# Altium project Power_Board-V1.0.PrjPcb (part 1 of 2)
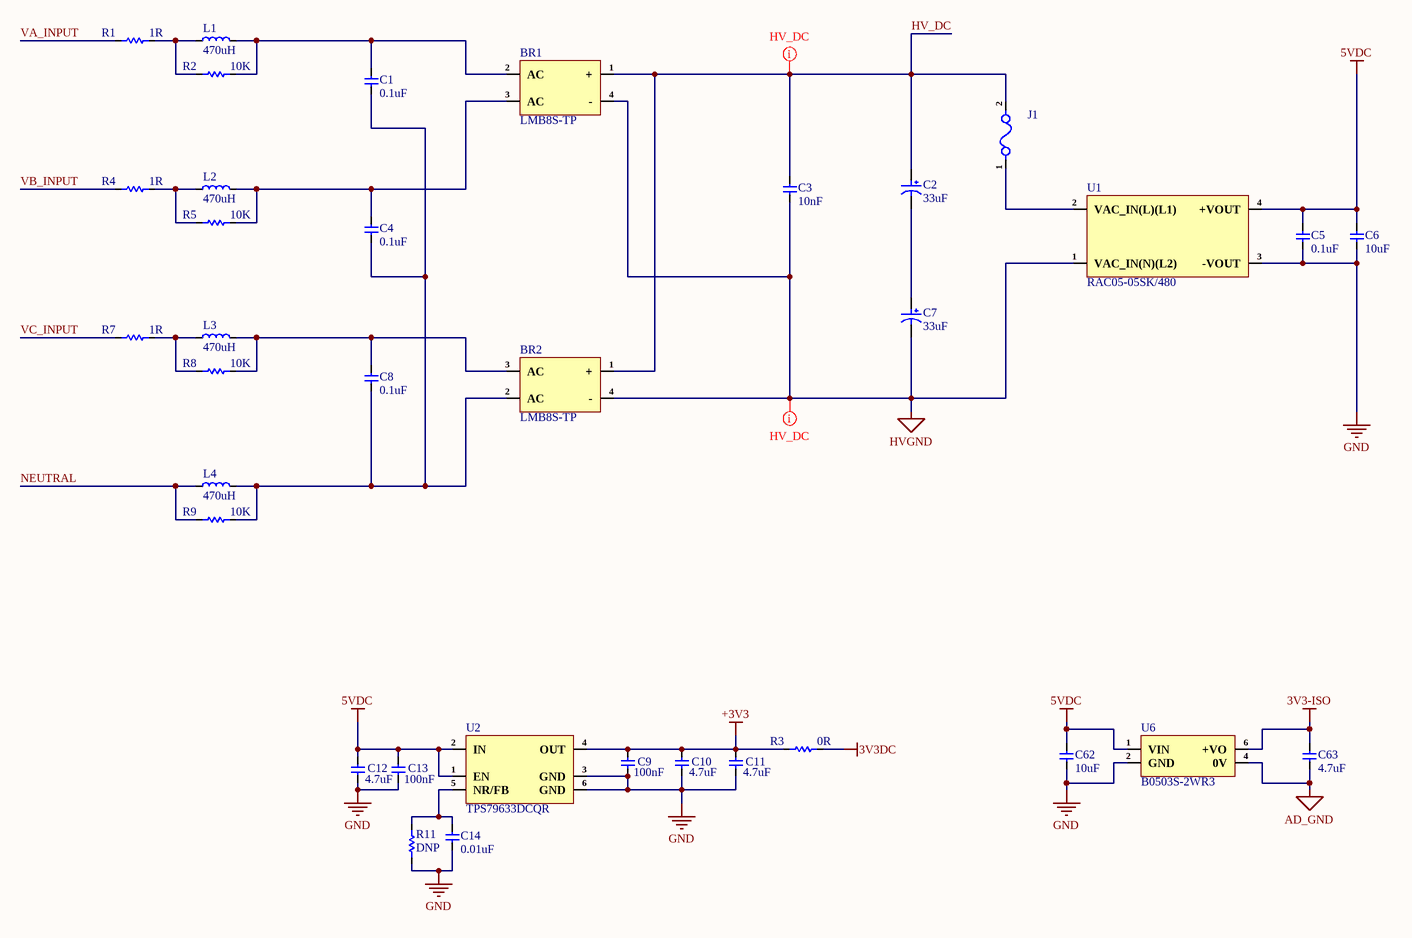
[diagram p0: Power_Supply_Sheet.SchDoc]
4 sheets, 203 parts. Net scope: global (net labels, ports and power ports of the same name join across sheets).
Board file: Power_Board-V1.0.PcbDoc
Sheets:
  Power_Supply_Sheet.SchDoc
  Metering_Sheet.SchDoc
  Interface_Sheet.SchDoc
  Connector_Sheet.SchDoc

## Sheet Power_Supply_Sheet.SchDoc
size 420 x 297 mm; SheetNumber: 1; SheetTotal: 4

### Parts
BR1  LMB8S-TP  [LMBS-1]
BR2  LMB8S-TP  [LMBS-1]
C1  0.1uF  [B32921C3104M000]
C2  33uF  [87EC0494]
C3  10nF  [MPBH103J3A0701]
C4  0.1uF  [B32921C3104M000]
C5  0.1uF  [Cap-0805]
C6  10uF  [Cap-1210]
C7  33uF  [87EC0494]
C8  0.1uF  [B32921C3104M000]
C9  100nF  [Cap-0603]
C10  4.7uF  [Cap-0603]
C11  4.7uF  [Cap-0603]
C12  4.7uF  [Cap-0603]
C13  100nF  [Cap-0603]
C14  0.01uF  [Cap-0603]
C62  10uF  [Cap-0603]
C63  4.7uF  [Cap-0603]
J1  01550900M  [01550900M]  (value not drawn)
L1  470uH  [XRNR6045-470uH/M]
L2  470uH  [XRNR6045-470uH/M]
L3  470uH  [XRNR6045-470uH/M]
L4  470uH  [XRNR6045-470uH/M]
R1  1R  [RES-2512]
R2  10K  [Res-1206]
R3  0R  [Res-0603]
R4  1R  [RES-2512]
R5  10K  [Res-1206]
R7  1R  [RES-2512]
R8  10K  [Res-1206]
R9  10K  [Res-1206]
R11  DNP  [Res-0603]
U1  RAC05-05SK/480  [RAC05-05SK/480]
U2  TPS79633DCQR  [SOT-223-6_]
U6  B0503S-2WR3  [B0503S-2WR3]

### Nets
3V3-ISO: C63.2 U6.6(+VO)
3V3DC: R3.1
5VDC: C5.2 C6.2 C12.2 C13.2 C62.2 U1.4(+VOUT) U2.1(EN) U2.2(IN) U6.1(VIN)
+3V3: C9.2 C10.2 C11.2 R3.2 U2.4(OUT)
AD_GND: C63.1 U6.4(0V)
GND: C5.1 C6.1 C9.1 C10.1 C11.1 C12.1 C13.1 C14.1 C62.1 R11.1 U1.3(-VOUT) U2.3(GND) U2.6(GND) U6.2(GND)
HVGND: BR1.4(-) BR2.4(-) C3.1 C7.2 U1.1(VAC_IN(N)(L2))
HV_DC: BR1.1(+) BR2.1(+) C2.1 C3.2 J1.2
NEUTRAL: L4.1 R9.1
VA_INPUT: R1.1
VB_INPUT: R4.1
VC_INPUT: R7.1
NetBR1_2: BR1.2(AC) C1.2 L1.2 R2.2
NetBR1_3: BR1.3(AC) C4.2 L2.2 R5.2
NetBR2_2: BR2.2(AC) C1.1 C4.1 C8.1 L4.2 R9.2
NetBR2_3: BR2.3(AC) C8.2 L3.2 R8.2
NetC2_2: C2.2 C7.1
NetC14_2: C14.2 R11.2 U2.5(NR/FB)
NetJ1_1: J1.1 U1.2(VAC_IN(L)(L1))
NetL1_1: L1.1 R1.2 R2.1
NetL2_1: L2.1 R4.2 R5.1
NetL3_1: L3.1 R7.2 R8.1

### Layout directives
net class HV_DC: HV_DC, HVGND

### Notes on the sheet
- File:
- Title:
- Date:
- Page
- Num:
- Total:
- Drawn By: Huzaifa Ali

### Library data of the parts
BR1 BR2 = LMB8S-TP: 30A 950mV@400mA 1A 800V LMBS-1 Bridge Rectifiers ROHS; Manufacturer: MCC(Micro Commercial Components); Manufacturer Part Number: LMB8S-TP; Package: LMBS-1; LCSC Part Number: C435904; Item Type: Bridge; ComponentLink1Description: LCSC; ComponentLink1URL: https://www.lcsc.com/product-detail/Bridge-Rectifiers_MCC-Micro-Commercial-Components-LMB8S-TP_C435904.html?s_z=n_MB8S-TP
C1 C4 C8 = B32921C3104M000: CAP FILM 0.1UF 20% 630VDC RADIAL; Manufacturer: TDK EPCOS; Item Type: Film Capacitors; Dielectric Material: Polypropylene; Value: 100nF; Voltage: 630V; Dielectric: PP; Voltage Rating (AC): 305V; Insulation Resistance: 100R; Dissipation Factor: 1%; Lead Diameter: 0.6mm; Lead Length: 6mm; Ratings: X2; Supplier: Rs; LCSC Part Number: C361368; Manufacturer Part Number: B32921C3104M000; RoHS: Yes; Stock: 6670; Pricing: 100=1.997, 250=1.855, 500=1.75, 1000=1.571 (DKK); Mounting Technology: Through Hole; Case/Package: Radial; Pins: 2NUMBER; Min Operating Temperature: -40°C; Max Operating Temperature: 110°C; Tolerance: 20%; Termination: PC Pins; Series: B32921; Voltage Rating (DC): 630V; Length: 13mm; Height: 12mm; Lead Pitch: 10mm; Depth: 6mm; Reach SVHC Compliant: No; RoHS Compliant: Yes; ComponentLink1URL: https://datasheet.ciiva.com/48779/1833206-48779695.pdf?src-supplier=Element14; ComponentLink1Description: https://datasheet.ciiva.com/48779/1833206-48779695.pdf?src-supplier=Element14
C2 C7 = 87EC0494: 33uF 420V 1Ω@100kHz 430mA@100kHz ±20% Plugin,D10xL16mm Aluminum Electrolytic Capacitors - Leaded ROHS; Manufacturer: KNSCHA; Manufacturer Part Number: 87EC0494; Package: Plugin,D10xL16mm; LCSC Part Number: C6718366; Item Type: Capacitor; ComponentLink1Description: LCSC; ComponentLink1URL: https://www.lcsc.com/product-detail/Aluminum-Electrolytic-Capacitors-Leaded_KNSCHA-87EC0494_C6718366.html
C3 = MPBH103J3A0701: 10nF -40℃~+100℃ ±5% 1kV Through Hole,P=7.5mm Film Capacitors RoHS; Manufacturer: KYET; Manufacturer Part Number: MPBH103J3A0701; Package: Through Hole,P=7.5mm; LCSC Part Number: C2928848; Item Type: Capacitor; ComponentLink1Description: LCSC; ComponentLink1URL: https://www.lcsc.com/product-detail/C2928848.html
C5 = CL21B104KBCNNNC: Multilayer Ceramic Capacitor, 0.1 uF, 50 V, ± 10%, X7R, 0805 [2012 Metric]; Manufacturer: Samsung; Value: 100nF; Voltage Rating: 50V; Supplier: Digikey; Supplier Part Number: 1276-1003-1-ND; Manufacturer Part Number: CL21B104KBCNNNC; RoHS: Yes; Category: Ceramic Capacitors; Stock: 2193973; Pricing: 1=0.1, 10=0.042, 50=0.024, 100=0.0186, 500=0.01404, 1000=0.01103 (USD); Mounting Technology: Surface Mount; Case/Package: 0805; Case Code (Metric): 2012; Case Code (Imperial): 0805; Material: Ceramic; Min Operating Temperature: -55°C; Max Operating Temperature: 125°C; Tolerance: 10%; Dielectric: X7R; Packaging: Tape and Reel; Voltage: 50V; Series: CL; Construction: Flat; Voltage Rating (DC): 50V; Length: 2mm; Width: 0.049inch; Height: 0.85mm; Depth: 1.25mm; Thickness: 0.037inch; Radiation Hardening: No; RoHS Compliant: Yes; Lead Free: 5697LeadFree; ComponentLink1URL: https://datasheet.ciiva.com/25710/cl21b104kbcnnnc-25710182.pdf?src-supplier=Digikey; ComponentLink1Description: https://datasheet.ciiva.com/25710/cl21b104kbcnnnc-25710182.pdf?src-supplier=Digikey; ComponentLink2URL: https://datasheet.ciiva.com/29199/454152-da-01-en-vs-kondensator-0805-29199814.pdf?src-supplier=Conrad; ComponentLink2Description: https://datasheet.ciiva.com/29199/454152-da-01-en-vs-kondensator-0805-29199814.pdf?src-supplier=Conrad; Item Type: Capacitor
C6 = CC1210KKX7R9BB106: CAP CER 10UF 50V X7R 1210; Manufacturer: Yageo; Item Type: Capacitors; Tolerance: 10%; Supplier: Farnell; LCSC Part Number: C596319; Manufacturer Part Number: CC1210KKX7R9BB106; RoHS: Yes; Stock: 76; Mounting Technology: Surface Mount; Case/Package: 1210; Case Code (Metric): 3225; Case Code (Imperial): 1210; Min Operating Temperature: -55°C; Max Operating Temperature: 125°C; Value: 10uF; Dielectric: X7R; Packaging: Cut Tape; Voltage Rating: 50V; Voltage Rating (DC): 50V; Series: CC; Length: 0.126inch; Width: 0.098inch; Thickness: 0.11inch; Lead Free: Lead Free; Halogen Free: Halogen Free; RoHS Compliant: Yes; ComponentLink1URL: https://datasheet.octopart.com/CC1210KKX7R9BB106-Yageo-datasheet-147453679.pdf?src-supplier=Newark; ComponentLink1Description: https://datasheet.octopart.com/CC1210KKX7R9BB106-Yageo-datasheet-147453679.pdf?src-supplier=Newark; ComponentLink2URL: https://datasheet.octopart.com/CC1210KKX7R9BB106-Yageo-datasheet-166511530.pdf?src-supplier=Future+Electronics; ComponentLink2Description: https://datasheet.octopart.com/CC1210KKX7R9BB106-Yageo-datasheet-166511530.pdf?src-supplier=Future+Electronics; ComponentLink3URL: http://www.yageo.com/documents/recent/UPY-GPHC_X7R_6.3V-to-50V_18.pdf?src-supplier=Digikey; ComponentLink3Description: http://www.yageo.com/documents/recent/UPY-GPHC_X7R_6.3V-to-50V_18.pdf?src-supplier=Digikey; ComponentLink4URL: http://www.yageo.com/exep/pages/download/literatures/ProductSelectionGuide%202014_Final_2.pdf?src-supplier=Digikey; ComponentLink4Description: http://www.yageo.com/exep/pages/download/literatures/ProductSelectionGuide%202014_Final_2.pdf?src-supplier=Digikey; ComponentLink5URL: https://datasheet.octopart.com/CC1210KKX7R9BB106-Yageo-datasheet-151948686.pdf?src-supplier=Farnell; ComponentLink5Description: https://datasheet.octopart.com/CC1210KKX7R9BB106-Yageo-datasheet-151948686.pdf?src-supplier=Farnell
C9 C13 = CC0603JRX7R8BB104: CAP CER 0.1UF 25V X7R 0603; Manufacturer: Yageo; Tolerance: 5%; Item Type: Capacitors; Manufacturer Part Number: CC0603JRX7R8BB104; RoHS: Yes; Dielectric: X7R; LCSC Part Number: C327087; ComponentLink1Description: https://datasheet.ciiva.com/11465/upy-gphc-x7r-6-3v-to-50v-8-11465031.pdf?src-supplier=Avnet; ComponentLink1URL: https://datasheet.ciiva.com/11465/upy-gphc-x7r-6-3v-to-50v-8-11465031.pdf?src-supplier=Avnet; Supplier: Digikey; Stock: 448767; Pricing: 1=0.1, 10=0.057, 50=0.039, 100=0.0335, 500=0.02436, 1000=0.0215 (USD); Mounting Technology: Surface Mount; Case/Package: 0603; Case Code (Imperial): 0603; Case Code (Metric): 1608; Weight: 7.1E-05oz; Min Operating Temperature: -55°C; Max Operating Temperature: 125°C; Voltage Rating: 25V; Voltage Rating (DC): 25V; Packaging: Tape and Reel; Value: 100nF; Termination: SMD/SMT; Series: CC; Construction: Flat; Length: 1.6mm; Width: 0.031inch; Height: 0.8mm; Thickness: 0.035inch; Lead Free: Lead Free; Halogen Free: Halogen Free; RoHS Compliant: Yes
C10-C12 = CC0603KRX5R7BB475: CAP CER 4.7UF 16V X5R 0603; Manufacturer: Yageo; Item Type: Capacitor; Tolerance: 10%; LCSC Part Number: C277476; Manufacturer Part Number: CC0603KRX5R7BB475; RoHS: Yes; Case/Package: 0603; Case Code (Metric): 1608; Case Code (Imperial): 0603; Weight: 7.1E-05oz; Min Operating Temperature: -55°C; Max Operating Temperature: 85°C; Packaging: Tape and Reel; Voltage Rating: 16V; Dielectric: X5R; Termination: SMD/SMT; Voltage Rating (DC): 16V; Series: CC; Height: 0.8mm; RoHS Compliant: Yes; Halogen Free: Halogen Free; Lead Free: Lead Free; ComponentLink1URL: http://www.mouser.com/ds/2/447/UPY-GPHC_X5R_4V-to-50V_25-1131599.pdf?src-supplier=Mouser; ComponentLink1Description: http://www.mouser.com/ds/2/447/UPY-GPHC_X5R_4V-to-50V_25-1131599.pdf?src-supplier=Mouser; ComponentLink2URL: http://www.yageo.com/documents/recent/UPY-GPHC_X5R_4V-to-50V_25.pdf?src-supplier=Digi-Key; ComponentLink2Description: http://www.yageo.com/documents/recent/UPY-GPHC_X5R_4V-to-50V_25.pdf?src-supplier=Digi-Key; Supplier 1: Digi-Key; Category: Ceramic Capacitors; Stock 1: 547703; Pricing 1: 1=0.20000, 10=0.13800, 50=0.08280, 100=0.06990, 500=0.04784, 1000=0.04233 (USD); Mount: Surface Mount; Capacitance: 4.7uF; Resistor Type: Ceramic; Length: 1.6mm; Width: 0.8mm; Thickness: 0.037inch; Depth: 0.8mm; Supplier Part Number 1: 311-1785-1-ND
C14 = GRM1885C1H103JA01D: CAP CER 10000PF 50V C0G/NP0 0603; Manufacturer: Murata; Material: Ceramic; Tolerance: 5%; Dielectric: C0G; Capacitance: 10nF; Manufacturer Part Number: GRM1885C1H103JA01D; RoHS: Yes; Category: Ceramic Capacitors; Case/Package: 0603; Case Code (Imperial): 0603; Case Code (Metric): 1608; Min Operating Temperature: -55°C; Max Operating Temperature: 125°C; Voltage: 50V; Packaging: Tape and Reel; Voltage Rating: 50V; Package Quantity: 4000; Voltage Rating (DC): 50V; Termination: SMD/SMT; Series: GRM; Length: 1.6mm; Width: 0.8mm; Height: 0.8mm; Depth: 0.8mm; RoHS Compliant: Yes; Lead Free: Lead Free; ComponentLink1URL: https://datasheet.ciiva.com/41860/partnumbering-e-01-41860759.pdf?src-supplier=Digi-Key; ComponentLink1Description: https://datasheet.ciiva.com/41860/partnumbering-e-01-41860759.pdf?src-supplier=Digi-Key; ComponentLink2URL: https://datasheet.ciiva.com/29537/partnumbering-e-01-29537910.pdf?src-supplier=Digi-Key; ComponentLink2Description: https://datasheet.ciiva.com/29537/partnumbering-e-01-29537910.pdf?src-supplier=Digi-Key; Supplier 1: RSComponents; Stock 1: 80000; Pricing 1: 4000=0.03500, 8000=0.03200 (GBP); Mount: Surface Mount; Thickness: 0.035inch; Lead Pitch: 0.5mm; REACH SVHC: No SVHC; Supplier Part Number 1: 1449032
C62 = GRM188Z71A106KA73D: CAP CER 10UF 10V X7R 0603; Manufacturer: Murata; Item Type: Capacitor; Material: 4241ConductorMaterial; Tolerance: 10%; Supplier: Mouser; LCSC Part Number: C2959727; Manufacturer Part Number: GRM188Z71A106KA73D; RoHS: Yes; Stock: 390983; Pricing: 1=0.36, 10=0.155, 50=0.155, 100=0.104, 1000=0.094, 10000=0.065 (USD); Case/Package: 345Case; Min Operating Temperature: -55°C; Max Operating Temperature: 125°C; Value: 10uF; Voltage Rating: 10V; Length: 1.6mm; Width: 800um; Height: 1mm; Thickness: 800um; RoHS Compliant: Yes; ComponentLink1URL: https://datasheet.octopart.com/GRM188Z71A106KA73D-Murata-datasheet-165579666.pdf?src-supplier=TME; ComponentLink1Description: https://datasheet.octopart.com/GRM188Z71A106KA73D-Murata-datasheet-165579666.pdf?src-supplier=TME
C63 = GRM188Z71A475KE15D: CAP CER 4.7UF 10V X7R 0603; Manufacturer: Murata; Item Type: Capacitors; Material: 4241ConductorMaterial; Tolerance: 10%; Supplier: Mouser; LCSC Part Number: C913474; Manufacturer Part Number: GRM188Z71A475KE15D; RoHS: Yes; Stock: 33218; Pricing: 1=0.24, 10=0.1, 50=0.1, 100=0.063, 1000=0.055, 10000=0.041 (USD); Case/Package: 0603; Min Operating Temperature: -55°C; Max Operating Temperature: 125°C; Value: 4.7uF; Voltage Rating: 10V; Length: 1.6mm; Width: 800um; Height: 950um; Thickness: 800um; RoHS Compliant: Yes; ComponentLink1URL: https://datasheet.octopart.com/GRM188Z71A475KE15D-Murata-datasheet-149523299.pdf?src-supplier=Newark; ComponentLink1Description: https://datasheet.octopart.com/GRM188Z71A475KE15D-Murata-datasheet-149523299.pdf?src-supplier=Newark; ComponentLink2URL: https://datasheet.octopart.com/GRM188Z71A475KE15D-Murata-datasheet-165579666.pdf?src-supplier=TME; ComponentLink2Description: https://datasheet.octopart.com/GRM188Z71A475KE15D-Murata-datasheet-165579666.pdf?src-supplier=TME
J1 = 01550900M: FUSE BLOK CARTRIDGE 125V 10A SMD; Manufacturer: Littelfuse; Item Type: Fuse Holders; Supplier: Digikey; LCSC Part Number: C108518; Manufacturer Part Number: 01550900M; RoHS: Yes; Stock: 4038; Pricing: 1=2.5, 5=2.072, 10=1.912, 50=1.586, 100=1.4631, 250=1.31448, 500=1.21164, 1000=1.11633, 5000=1.06138 (USD); Lead Free: 5697LeadFree; Reach SVHC Compliant: 4187SVHC; ComponentLink1URL: https://datasheet.ciiva.com/3812/01550900m-3812998.pdf?src-supplier=Arrow+Electronics; ComponentLink1Description: https://datasheet.ciiva.com/3812/01550900m-3812998.pdf?src-supplier=Arrow+Electronics
L1-L4 = XRNR6045-470uH/M: 420mA 470uH Magnetic Shielded Inductor ±20% 500mA 1.8Ω SMD,6x6mm Fixed Inductors ROHS; Manufacturer: XR; Manufacturer Part Number: XRNR6045-470uH/M; Package: SMD,6x6mm; LCSC Part Number: C5339751; Item Type: Inductor
R1 R4 R7 = HoLRT2512-3W-1R-1: 3W 1Ω SMD ±50ppm/℃ Current Sense Resistor ±1% 2512 Chip Resistor - Surface Mount RoHS; Manufacturer: Milliohm; Manufacturer Part Number: HoLRT2512-3W-1R-1; Package: 2512; LCSC Part Number: C5127857; Item Type: Resistor; ComponentLink1Description: LCSC; ComponentLink1URL: https://www.lcsc.com/product-detail/C5127857.html
R2 R5 R8 R9 = AC1206FR-7W10KL: RES 10K OHM 1% 1/2W 1206; Manufacturer: Yageo; Item Type: Resistors; Value: 10kR; Supplier: Mouser; LCSC Part Number: C326700; Manufacturer Part Number: AC1206FR-7W10KL; RoHS: No; Stock: 10222; Pricing: 1=0.14, 10=0.052, 50=0.052, 100=0.029, 1000=0.018, 10000=0.011 (USD); Case/Package: 340Case; Packaging: 10Packaging
R3 R11 = RC0603JR-070RL: RES 0 OHM JUMPER 1/10W 0603; Manufacturer: Yageo; Resistance: 0mR; Tolerance: 1%; Power Rating: 100mW; Voltage Rating (DC): 50V; Temperature Coefficient: 200ppm/°C; Resistance Tolerance: 5%; Item Type: Resistor; Supplier 1: Digi-Key; Manufacturer Part Number: RC0603JR-070RL; RoHS: Yes; Category: Chip SMD Resistors; Stock 1: 18081776; Pricing 1: 1=0.10000, 10=0.01700, 25=0.01240, 50=0.00960, 100=0.00700, 250=0.00536, 500=0.00430, 1000=0.00316 (USD); Case/Package: 0603; Number of Pins: 2; Contact Plating: Tin,Matte; Case Code (Imperial): 0603; Case Code (Metric): 1608; Size Code: 0603; Min Operating Temperature: -55°C; Max Operating Temperature: 155°C; Resistor Type: Thick Film; Packaging: Tape and Reel; Termination: SMD/SMT; Series: RC; Technology: THICK FILM; Package Quantity: 5000; Voltage Rating: 50V; Features: Moisture Resistant; Max Power Dissipation: 100mW; Number of Terminations: 2; Construction: Rectangular; Length: 1.6mm; Width: 0.8mm; Height: 0.45mm; Depth: 0.8mm; Radiation Hardening: No; Reach SVHC Compliant: No SVHC; Lead Free: Lead Free; RoHS Compliant: Yes; Military Standard: Not; Supplier Part Number 1: 311-0.0GRCT-ND; LCSC Part Number: C95177
U1 = RAC05-05SK/480: AC/DC CONVERTER 5V 5W; Manufacturer: Recom Power; Item Type: Voltage Regulators - Switching; Approvals: CE, EN, IEC, UL; Efficiency: 63%; Max Supply Voltage: 528V; Max Output current: 1A; Max Output Voltage: 5.05V; Min Input Voltage: 85V; Min Output Voltage: 4.95V; Nominal Supply Voltage: 480V; Number of Circuits: 1; Supplier: DigiKey; Supplier Part Number: 945-3185-ND; Manufacturer Part Number: RAC05-05SK/480; RoHS: Compliant; Stock: 856; Pricing: 1=18.3, 5=17.424, 10=17.063, 25=16.596, 50=16.251, 100=15.9134, 250=15.47772, 500=15.15614 (USD); Height: 23mm; Height - Seated (Max): 23.5mm; Length: 52.5mm; Lifecycle Status: Production; Max Operating Temperature: 60°C; Max Output Power: 5W; Min Operating Temperature: -40°C; Nominal Output Voltage: 5V; Number of Outputs: 1; Number of Terminals: 4; Output Current: 1A; Output Power: 5W; Output Voltage: 5V; REACH SVHC: Yes; Schedule B: 8504409580; Weight: 58g; Width: 27.4mm; ComponentLink1URL: https://datasheet.octopart.com:443/RAC05-05SK-480-Recom-Power-datasheet-181184451.pdf?src-supplier=IHS; ComponentLink1Description: https://datasheet.octopart.com:443/RAC05-05SK-480-Recom-Power-datasheet-181184451.pdf?src-supplier=IHS; ComponentLink2URL: https://datasheet.octopart.com:443/RAC05-05SK-480-Recom-Power-datasheet-133924410.pdf?src-supplier=Farnell; ComponentLink2Description: https://datasheet.octopart.com:443/RAC05-05SK-480-Recom-Power-datasheet-133924410.pdf?src-supplier=Farnell; ComponentLink3URL: https://datasheet.octopart.com:443/RAC05-05SK-480-Recom-Power-datasheet-148822129.pdf?src-supplier=Electro+Sonic; ComponentLink3Description: https://datasheet.octopart.com:443/RAC05-05SK-480-Recom-Power-datasheet-148822129.pdf?src-supplier=Electro+Sonic; ComponentLink4URL: https://datasheet.octopart.com:443/RAC05-05SK-480-Recom-Power-datasheet-138144762.pdf?src-supplier=RS+(Formerly+Allied+Electronics); ComponentLink4Description: https://datasheet.octopart.com:443/RAC05-05SK-480-Recom-Power-datasheet-138144762.pdf?src-supplier=RS+(Formerly+Allied+Electronics); ComponentLink5URL: https://datasheet.octopart.com:443/RAC05-05SK-480-Recom-Power-datasheet-165581948.pdf?src-supplier=TME; ComponentLink5Description: https://datasheet.octopart.com:443/RAC05-05SK-480-Recom-Power-datasheet-165581948.pdf?src-supplier=TME
U2 = TPS79633DCQR: IC REG LINEAR 3.3V 1A SOT223-6; Manufacturer: Texas Instruments; Supplier: Mouser; Supplier Part Number: 595-TPS79633DCQR; Manufacturer Part Number: TPS79633DCQR; RoHS: Yes; Category: Voltage Regulators - Linear; Stock: 3089; Pricing: 1=3.24, 10=2.75, 50=2.75, 100=2.39, 1000=1.72, 10000=1.56 (USD); Length: 6.5mm; Width: 3.5mm; Thickness: 1.6mm; ComponentLink1URL: https://datasheet.ciiva.com/2045/tps79601-2045264.pdf?src-supplier=Digi-Key; ComponentLink1Description: https://datasheet.ciiva.com/2045/tps79601-2045264.pdf?src-supplier=Digi-Key; ComponentLink2URL: https://datasheet.ciiva.com/22704/1846966-22704703.pdf?src-supplier=Element14; ComponentLink2Description: https://datasheet.ciiva.com/22704/1846966-22704703.pdf?src-supplier=Element14; ComponentLink3URL: https://datasheet.ciiva.com/41462/001015136-da-01-en-ic-reg-ldo-3-3v-1-tps79633dcqr-sot-6-tid-41462982.pdf?src-supplier=Conrad; ComponentLink3Description: https://datasheet.ciiva.com/41462/001015136-da-01-en-ic-reg-ldo-3-3v-1-tps79633dcqr-sot-6-tid-41462982.pdf?src-supplier=Conrad; LCSC Part Number: C485803; Item Type: IC
U6 = B0503S-2WR3: SIP-4 Isolated Power Modules ROHS; Manufacturer: YLPTEC; Item Type: Module; Manufacturer Part Number: B0503S-2WR3; Package: SIP-4; LCSC Part Number: C5369472; ComponentLink1Description: LCSC; ComponentLink1URL: https://www.lcsc.com/product-detail/Isolated-Power-Modules_YLPTEC-B0503S-2WR3_C5369472.html?s_z=n_B0503S-2WR3

## Sheet Metering_Sheet.SchDoc
size 420 x 297 mm; SheetNumber: 2; SheetTotal: 4
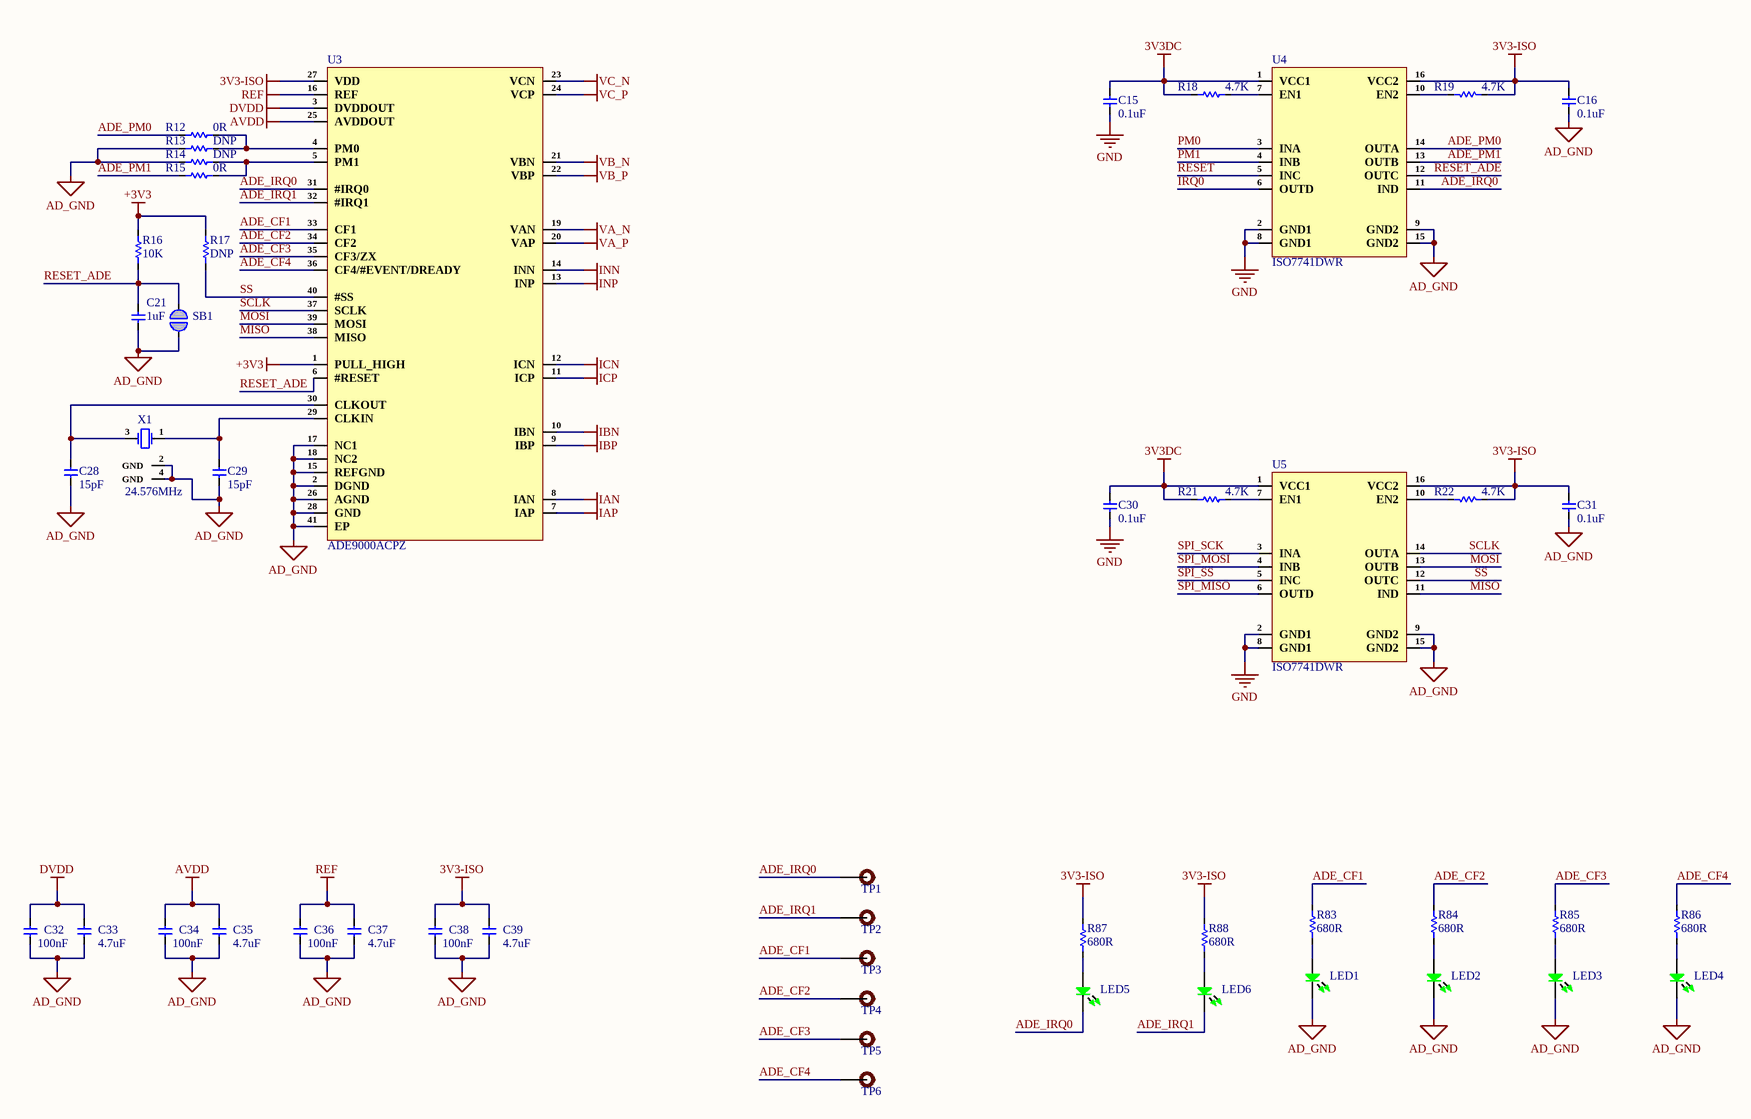
[diagram p1: Metering_Sheet.SchDoc]

### Parts
C15  0.1uF  [Cap-0603]
C16  0.1uF  [Cap-0603]
C21  1uF  [Cap-0402]
C28  15pF  [Cap-0603]
C29  15pF  [Cap-0603]
C30  0.1uF  [Cap-0603]
C31  0.1uF  [Cap-0603]
C32  100nF  [Cap-0402]
C33  4.7uF  [Cap-0402]
C34  100nF  [Cap-0402]
C35  4.7uF  [Cap-0402]
C36  100nF  [Cap-0402]
C37  4.7uF  [Cap-0402]
C38  100nF  [Cap-0402]
C39  4.7uF  [Cap-0402]
LED1  Emerald  [LED-0603]  (value not drawn)
LED2  Emerald  [LED-0603]  (value not drawn)
LED3  Emerald  [LED-0603]  (value not drawn)
LED4  Emerald  [LED-0603]  (value not drawn)
LED5  Emerald  [LED-0603]  (value not drawn)
LED6  Emerald  [LED-0603]  (value not drawn)
R12  0R  [Res-0402]
R13  DNP  [Res-0402]
R14  DNP  [Res-0402]
R15  0R  [Res-0402]
R16  10K  [Res-0402]
R17  DNP  [Res-0402]
R18  4.7K  [Res-0603]
R19  4.7K  [Res-0603]
R21  4.7K  [Res-0603]
R22  4.7K  [Res-0603]
R83  680R  [Res-0603]
R84  680R  [Res-0603]
R85  680R  [Res-0603]
R86  680R  [Res-0603]
R87  680R  [Res-0603]
R88  680R  [Res-0603]
SB1  Solder Bridge 0603  [Solder Bridge]  (value not drawn)  (no BOM)
TP1  TEST POINT  [Test-point]  (value not drawn)  (no BOM)
TP2  TEST POINT  [Test-point]  (value not drawn)  (no BOM)
TP3  TEST POINT  [Test-point]  (value not drawn)  (no BOM)
TP4  TEST POINT  [Test-point]  (value not drawn)  (no BOM)
TP5  TEST POINT  [Test-point]  (value not drawn)  (no BOM)
TP6  TEST POINT  [Test-point]  (value not drawn)  (no BOM)
U3  ADE9000ACPZ  [40-LFCSP-WQ (6x6)]
U4  ISO7741DWR  [SOIC-16-300mil]
U5  ISO7741DWR  [SOIC-16-300mil]
X1  24.576MHz  [SMD3225-4P]

### Nets
3V3-ISO: C16.2 C31.2 C38.2 C39.2 R19.2 R22.2 R87.2 R88.2 U3.27(VDD) U4.16(VCC2) U5.16(VCC2)
3V3DC: C15.2 C30.2 R18.2 R21.2 U4.1(VCC1) U5.1(VCC1)
+3V3: R16.2 R17.2 U3.1(PULL_HIGH)
AD_GND: C16.1 C21.1 C28.1 C29.1 C31.1 C32.1 C33.1 C34.1 C35.1 C36.1 C37.1 C38.1 C39.1 LED1.2 LED2.2 LED3.2 LED4.2 R13.1 R14.1 SB1.1 U3.2(DGND) U3.15(REFGND) U3.17(NC1) U3.18(NC2) U3.26(AGND) U3.28(GND) U3.41(EP) U4.9(GND2) U4.15(GND2) U5.9(GND2) U5.15(GND2) X1.2(GND) X1.4(GND)
AVDD: C34.2 C35.2 U3.25(AVDDOUT)
DVDD: C32.2 C33.2 U3.3(DVDDOUT)
GND: C15.1 C30.1 U4.2(GND1) U4.8(GND1) U5.2(GND1) U5.8(GND1)
IAN: U3.8(IAN)
IAP: U3.7(IAP)
IBN: U3.10(IBN)
IBP: U3.9(IBP)
ICN: U3.12(ICN)
ICP: U3.11(ICP)
INN: U3.14(INN)
INP: U3.13(INP)
REF: C36.2 C37.2 U3.16(REF)
VA_N: U3.19(VAN)
VA_P: U3.20(VAP)
VB_N: U3.21(VBN)
VB_P: U3.22(VBP)
VC_N: U3.23(VCN)
VC_P: U3.24(VCP)
ADE_CF1: R83.2 TP3.1 U3.33(CF1)
ADE_CF2: R84.2 TP4.1 U3.34(CF2)
ADE_CF3: R85.2 TP5.1 U3.35(CF3/ZX)
ADE_CF4: R86.2 TP6.1 U3.36(CF4/#EVENT/DREADY)
ADE_IRQ0: LED5.2 TP1.1 U3.31(#IRQ0) U4.11(IND)
ADE_IRQ1: LED6.2 TP2.1 U3.32(#IRQ1)
ADE_PM0: R12.1 U4.14(OUTA)
ADE_PM1: R15.1 U4.13(OUTB)
IRQ0: U4.6(OUTD)
MISO: U3.38(MISO) U5.11(IND)
MOSI: U3.39(MOSI) U5.13(OUTB)
PM0: U4.3(INA)
PM1: U4.4(INB)
RESET: U4.5(INC)
RESET_ADE: C21.2 R16.1 SB1.2 U3.6(#RESET) U4.12(OUTC)
SCLK: U3.37(SCLK) U5.14(OUTA)
SPI_MISO: U5.6(OUTD)
SPI_MOSI: U5.4(INB)
SPI_SCK: U5.3(INA)
SPI_SS: U5.5(INC)
SS: R17.1 U3.40(#SS) U5.12(OUTC)
NetC28_2: C28.2 U3.30(CLKOUT) X1.3(CRYSTAL)
NetC29_2: C29.2 U3.29(CLKIN) X1.1(CRYSTAL)
NetLED1_1: LED1.1 R83.1
NetLED2_1: LED2.1 R84.1
NetLED3_1: LED3.1 R85.1
NetLED4_1: LED4.1 R86.1
NetLED5_1: LED5.1 R87.1
NetLED6_1: LED6.1 R88.1
NetR12_2: R12.2 R13.2 U3.4(PM0)
NetR14_2: R14.2 R15.2 U3.5(PM1)
NetR18_1: R18.1 U4.7(EN1)
NetR19_1: R19.1 U4.10(EN2)
NetR21_1: R21.1 U5.7(EN1)
NetR22_1: R22.1 U5.10(EN2)

### Notes on the sheet
- File:
- Title:
- Date:
- Page
- Num:
- Total:
- Drawn By: Huzaifa Ali

### Library data of the parts
C15 C16 C30 C31 = GCJ188R71H104KA12D: CAP CER 0.1UF 50V X7R 0603; Manufacturer: Murata; Item Type: Capacitors; Material: 4241ConductorMaterial; Value: 100nF; Tolerance: 10%; Supplier: Mouser; LCSC Part Number: C161115; Manufacturer Part Number: GCJ188R71H104KA12D; RoHS: Yes; Stock: 342536; Pricing: 1=0.13, 10=0.056, 50=0.056, 100=0.036, 1000=0.032, 10000=0.02 (USD); Mounting Technology: Surface Mount; Case/Package: 0603; Case Code (Metric): 1608; Case Code (Imperial): 0603; Min Operating Temperature: -55°C; Max Operating Temperature: 125°C; Dielectric: X7R; Package Quantity: 1; Voltage Rating: 50V; Packaging: Tape and Reel; Voltage Rating (DC): 50V; Termination: SMD/SMT; Features: Soft Termination; Series: GCJ; Construction: Flat; Length: 1.6mm; Width: 0.031inch; Height: 0.8mm; Thickness: 0.035inch; Depth: 0.8mm; Ratings: AEC-Q200; Radiation Hardening: No; RoHS Compliant: Yes; Lead Free: 5697LeadFree; ComponentLink1URL: https://datasheet.ciiva.com/135/product-135604.pdf?src-supplier=Digikey; ComponentLink1Description: https://datasheet.ciiva.com/135/product-135604.pdf?src-supplier=Digikey; ComponentLink2URL: https://datasheet.ciiva.com/26889/getdatasheetpartid-369886-26889118.pdf?src-supplier=Verical; ComponentLink2Description: https://datasheet.ciiva.com/26889/getdatasheetpartid-369886-26889118.pdf?src-supplier=Verical; ComponentLink3URL: https://datasheet.ciiva.com/135/s0717e-135605.pdf?src-supplier=Digikey; ComponentLink3Description: https://datasheet.ciiva.com/135/s0717e-135605.pdf?src-supplier=Digikey; ComponentLink4URL: https://datasheet.ciiva.com/135/s0717e-135606.pdf?src-supplier=Digikey; ComponentLink4Description: https://datasheet.ciiva.com/135/s0717e-135606.pdf?src-supplier=Digikey; ComponentLink5URL: https://datasheet.ciiva.com/16440/c03e-16440425.pdf?src-supplier=Future+Electronics; ComponentLink5Description: https://datasheet.ciiva.com/16440/c03e-16440425.pdf?src-supplier=Future+Electronics
C21 = C1005X5R1V105K050BC: CAP CER 1UF 35V X5R 0402; Manufacturer: TDK; Material: 4241ConductorMaterial; Tolerance: 10%; Item Type: Capacitors; Dielectric Material: Ceramic; Supplier: Digikey; Supplier Part Number: 445-9073-1-ND; Manufacturer Part Number: C1005X5R1V105K050BC; RoHS: Yes; Stock: 682645; Pricing: 1=0.15, 10=0.087, 50=0.061, 100=0.0528, 500=0.03898, 1000=0.03468, 2500=0.03011, 5000=0.02735 (USD); Mounting Technology: Surface Mount; Case/Package: 0402; Case Code (Metric): 1005; Case Code (Imperial): 0402; Min Operating Temperature: -55°C; Max Operating Temperature: 85°C; Packaging: Tape and Reel; Value: 1uF; Voltage Rating: 35V; Dielectric: X5R; Series: C; Length: 1mm; Depth: 0.5mm; Radiation Hardening: No; RoHS Compliant: Yes; ComponentLink1URL: https://datasheet.ciiva.com/26834/getdatasheetpartid-750449-26834298.pdf?src-supplier=Verical; ComponentLink1Description: https://datasheet.ciiva.com/26834/getdatasheetpartid-750449-26834298.pdf?src-supplier=Verical; Reach SVHC Compliant: No; Lead Free: Lead Free; ComponentLink2URL: https://datasheet.ciiva.com/28451/1796654-28451087.pdf?src-supplier=Element14; ComponentLink2Description: https://datasheet.ciiva.com/28451/1796654-28451087.pdf?src-supplier=Element14; ComponentLink3URL: https://datasheet.ciiva.com/22719/1796654-22719533.pdf?src-supplier=Element14; ComponentLink3Description: https://datasheet.ciiva.com/22719/1796654-22719533.pdf?src-supplier=Element14
C28 C29 = CC0603JRNPO9BN150: CAP CER 15PF 50V C0G/NPO 0603; Manufacturer: Yageo; Dielectric Material: Ceramic; Tolerance: 5%; Dielectric: C0G; Insulation Resistance: 100GR; Item Type: Capacitor; Supplier 1: Future Electronics; Manufacturer Part Number: CC0603JRNPO9BN150; RoHS: Yes; Category: Ceramic Capacitors; Stock 1: 832000; Pricing 1: 4000=0.0038, 16000=0.0036, 80000=0.0034, 160000=0.0033, 500000=0.0031 (USD); Mounting Technology: Surface Mount; Case/Package: 0603; Pins: 2; Case Code (Metric): 1608; Case Code (Imperial): 0603; Min Operating Temperature: -55°C; Max Operating Temperature: 125°C; Value: 15pF; Series: CC; Packaging: Tape and Reel; Package Quantity: 1; Termination: SMD/SMT; Voltage Rating: 50V; Length: 1.6mm; Width: 0.031inch; Height: 0.8mm; Depth: 0.8mm; Thickness: 0.035inch; Radiation Hardening: No; RoHS Compliant: Yes; Reach SVHC Compliant: No; Lead Free: Lead Free; ComponentLink1URL: https://datasheet.ciiva.com/144/mlccorderingcode-144635.pdf?src-supplier=Digi-Key; ComponentLink1Description: https://datasheet.ciiva.com/144/mlccorderingcode-144635.pdf?src-supplier=Digi-Key; ComponentLink2URL: https://datasheet.ciiva.com/144/mlccorderingcode-144636.pdf?src-supplier=Digi-Key; ComponentLink2Description: https://datasheet.ciiva.com/144/mlccorderingcode-144636.pdf?src-supplier=Digi-Key; ComponentLink3URL: https://datasheet.ciiva.com/8033/1443161-8033721.pdf?src-supplier=Element14; ComponentLink3Description: https://datasheet.ciiva.com/8033/1443161-8033721.pdf?src-supplier=Element14; ComponentLink4URL: https://datasheet.ciiva.com/28450/1443161-28450472.pdf?src-supplier=Element14; ComponentLink4Description: https://datasheet.ciiva.com/28450/1443161-28450472.pdf?src-supplier=Element14; ComponentLink5URL: https://datasheet.ciiva.com/144/mlccorderingcode-144634.pdf?src-supplier=Digi-Key; ComponentLink5Description: https://datasheet.ciiva.com/144/mlccorderingcode-144634.pdf?src-supplier=Digi-Key; ComponentLink6URL: https://datasheet.ciiva.com/8033/1734582-8033723.pdf?src-supplier=Element14; ComponentLink6Description: https://datasheet.ciiva.com/8033/1734582-8033723.pdf?src-supplier=Element14; ComponentLink7URL: https://datasheet.ciiva.com/8033/1734582-8033722.pdf?src-supplier=Element14; ComponentLink7Description: https://datasheet.ciiva.com/8033/1734582-8033722.pdf?src-supplier=Element14; ComponentLink8URL: https://datasheet.ciiva.com/11464/upy-gp-np0-16v-to-50v-8-11464727.pdf?src-supplier=Avnet; ComponentLink8Description: https://datasheet.ciiva.com/11464/upy-gp-np0-16v-to-50v-8-11464727.pdf?src-supplier=Avnet; Supplier Part Number 1: 4234670; LCSC Part Number: C107037
C32 C34 C36 C38 = CC0402KRX5R8BB104: CAP CER 0.1UF 25V X5R 0402; Manufacturer: Yageo; Item Type: Capacitor; Tolerance: 10%; LCSC Part Number: C106256; Manufacturer Part Number: CC0402KRX5R8BB104; RoHS: Yes; Case/Package: 0402; Case Code (Metric): 1005; Case Code (Imperial): 0402; Min Operating Temperature: -55°C; Max Operating Temperature: 85°C; Dielectric: X5R; Voltage Rating: 25V; Packaging: Tape and Reel; Voltage Rating (DC): 25V; Series: CC; Length: 0.039inch; Width: 0.02inch; Thickness: 0.022inch; Depth: 0.5mm; RoHS Compliant: Yes; Lead Free: Lead Free; ComponentLink1URL: http://www.mouser.com/ds/2/447/UPY-GPHC_X5R_4V-to-50V_25-1131599.pdf?src-supplier=Mouser; ComponentLink1Description: http://www.mouser.com/ds/2/447/UPY-GPHC_X5R_4V-to-50V_25-1131599.pdf?src-supplier=Mouser; ComponentLink2URL: http://www.yageo.com/documents/recent/UPY-GPHC_X5R_4V-to-50V-16.pdf?src-supplier=Future+Electronics; ComponentLink2Description: http://www.yageo.com/documents/recent/UPY-GPHC_X5R_4V-to-50V-16.pdf?src-supplier=Future+Electronics; ComponentLink3URL: http://www.yageo.com/documents/recent/UPY-GPHC_X5R_4V-to-50V_25.pdf?src-supplier=Digi-Key; ComponentLink3Description: http://www.yageo.com/documents/recent/UPY-GPHC_X5R_4V-to-50V_25.pdf?src-supplier=Digi-Key; Supplier 1: Digi-Key; Category: Ceramic Capacitors; Stock 1: 4598218; Pricing 1: 1=0.10000, 10=0.03800, 50=0.02100, 100=0.01710, 500=0.01224, 1000=0.00961, 2500=0.00874, 5000=0.00804 (USD); Mount: Surface Mount; Capacitance: 100nF; Resistor Type: Ceramic; Halogen Free: Halogen Free; Supplier Part Number 1: 311-1697-1-ND
C33 C35 C37 C39 = CL05A475MO5NUNC: CAP CER 4.7UF 16V X5R 0402; Manufacturer: Samsung; Material: 4241ConductorMaterial; Tolerance: 20%; Manufacturer Part Number: CL05A475MO5NUNC; RoHS: Yes; Case/Package: 0402; Min Operating Temperature: -55°C; Max Operating Temperature: 85°C; Voltage Rating: 16V; Length: 0.039inch; Width: 0.02inch; Height: 550um; Thickness: 0.022inch; RoHS Compliant: Yes; ComponentLink1URL: http://www.farnell.com/datasheets/2710653.pdf?src-supplier=Farnell; ComponentLink1Description: http://www.farnell.com/datasheets/2710653.pdf?src-supplier=Farnell; ComponentLink2URL: http://www.samsungsem.com/kr/support/product-search/mlcc/CL05A475MO5NUNC.jsp?src-supplier=Digikey; ComponentLink2Description: http://www.samsungsem.com/kr/support/product-search/mlcc/CL05A475MO5NUNC.jsp?src-supplier=Digikey; Supplier 1: Avnet; Category: Ceramic Capacitors; Stock 1: 50000; Pricing 1: 10000=0.09712 (USD); Mount: Surface Mount; Case Code (Metric): 1005; Case Code (Imperial): 0402; Packaging: Cut Tape; Capacitance: 4.7uF; Series: CL; Voltage Rating (DC): 16V; ComponentLink3URL: http://www.farnell.com/datasheets/2710653.pdf?src-supplier=Element14; ComponentLink3Description: http://www.farnell.com/datasheets/2710653.pdf?src-supplier=Element14; ComponentLink4URL: https://datasheet.octopart.com/CL05A475MO5NUNC-Samsung-Electro-Mechanics-datasheet-123102911.pdf?src-supplier=Future+Electronics; ComponentLink4Description: https://datasheet.octopart.com/CL05A475MO5NUNC-Samsung-Electro-Mechanics-datasheet-123102911.pdf?src-supplier=Future+Electronics; ComponentLink5URL: http://www.farnell.com/datasheets/2710653.pdf?src-supplier=Newark; ComponentLink5Description: http://www.farnell.com/datasheets/2710653.pdf?src-supplier=Newark; Supplier Part Number 1: CL05A475MO5NUNC
LED1-LED6 = NCD0603G2: Emerald 0603 Light Emitting Diodes (LED) ROHS; Manufacturer: Foshan NationStar Optoelectronics; Manufacturer Part Number: NCD0603G2; Package: 0603; LCSC Part Number: C87326; Item Type: LED; ComponentLink1Description: LCSC; ComponentLink1URL: https://www.lcsc.com/product-detail/Light-Emitting-Diodes-LED_Foshan-NationStar-Optoelectronics-NCD0603G2_C87326.html
R12 R15 = RC0402FR-070RL: RES 0 OHM JUMPER 1/16W 0402; Manufacturer: Yageo; Item Type: Resistors; Tolerance: 1%; Power Rating: 62.5mW; Voltage Rating: 50V; Temperature Coefficient: 200ppm/°C; Max Power Dissipation: 63mW; Manufacturer Part Number: RC0402FR-070RL; LCSC Part Number: C106231; Supplier 1: Mouser; RoHS: Yes; Stock 1: 8556842; Pricing 1: 1=0.10000, 10=0.01400, 50=0.01400, 100=0.00600, 1000=0.00300, 5000=0.00200, 10000=0.00100 (USD); Mount: Surface Mount; Case/Package: 0402; Contact Plating: Tin,Matte; Case Code (Imperial): 0402; Case Code (Metric): 1005; Size Code: 0402; Min Operating Temperature: -55°C; Max Operating Temperature: 155°C; Resistance: 0R; Resistor Type: Thick Film; Packaging: Tape and Reel; Termination: SMD/SMT; Features: Moisture Resistant; Series: RC; Number of Terminations: 2; Length: 1mm; Width: 0.5mm; Height: 0.35mm; Radiation Hardening: No; Lead Free: Lead Free; RoHS Compliant: Yes; ComponentLink1URL: https://datasheet.ciiva.com/8896/pyu-rc0402-51-rohs-l-6-8896149.pdf?src-supplier=Avnet; ComponentLink1Description: https://datasheet.ciiva.com/8896/pyu-rc0402-51-rohs-l-6-8896149.pdf?src-supplier=Avnet; ComponentLink2URL: https://datasheet.ciiva.com/16790/pyu-rc0402-51-rohs-l-6-r-16790444.pdf?src-supplier=Future+Electronics; ComponentLink2Description: https://datasheet.ciiva.com/16790/pyu-rc0402-51-rohs-l-6-r-16790444.pdf?src-supplier=Future+Electronics; Supplier Part Number 1: 603-RC0402FR-070RL
R13 R14 = RC0402FR-070RL: RES 0 OHM JUMPER 1/16W 0402; Manufacturer: Yageo; Item Type: Resistors; Resistance: 0R; Tolerance: 1%; Power Rating: 62.5mW; Voltage Rating: 50V; Temperature Coefficient: 200ppm/°C; Max Power Dissipation: 63mW; Manufacturer Part Number: RC0402FR-070RL; LCSC Part Number: C106231; Supplier 1: Mouser; RoHS: Yes; Stock 1: 8556842; Pricing 1: 1=0.10000, 10=0.01400, 50=0.01400, 100=0.00600, 1000=0.00300, 5000=0.00200, 10000=0.00100 (USD); Mount: Surface Mount; Case/Package: 0402; Contact Plating: Tin,Matte; Case Code (Imperial): 0402; Case Code (Metric): 1005; Size Code: 0402; Min Operating Temperature: -55°C; Max Operating Temperature: 155°C; Resistor Type: Thick Film; Packaging: Tape and Reel; Termination: SMD/SMT; Features: Moisture Resistant; Series: RC; Number of Terminations: 2; Length: 1mm; Width: 0.5mm; Height: 0.35mm; Radiation Hardening: No; Lead Free: Lead Free; RoHS Compliant: Yes; ComponentLink1URL: https://datasheet.ciiva.com/8896/pyu-rc0402-51-rohs-l-6-8896149.pdf?src-supplier=Avnet; ComponentLink1Description: https://datasheet.ciiva.com/8896/pyu-rc0402-51-rohs-l-6-8896149.pdf?src-supplier=Avnet; ComponentLink2URL: https://datasheet.ciiva.com/16790/pyu-rc0402-51-rohs-l-6-r-16790444.pdf?src-supplier=Future+Electronics; ComponentLink2Description: https://datasheet.ciiva.com/16790/pyu-rc0402-51-rohs-l-6-r-16790444.pdf?src-supplier=Future+Electronics; Supplier Part Number 1: 603-RC0402FR-070RL
R16 R17 = RC0402FR-0710KL: RES 10K OHM 1% 1/16W 0402; Manufacturer: Yageo; Resistance: 10kR; Temperature Coefficient: 100ppm/°C; Voltage Rating (DC): 50V; Power Rating: 62.5mW; Max Power Dissipation: 63mW; Item Type: Resistor; Supplier 1: Mouser; Manufacturer Part Number: RC0402FR-0710KL; RoHS: Yes; Category: Chip SMD Resistors; Stock 1: 18648329; Pricing 1: 1=0.10000, 10=0.01400, 50=0.01400, 100=0.00500, 1000=0.00300, 10000=0.00200 (USD); Case/Package: 0402; Number of Pins: 2; Case Code (Imperial): 0402; Case Code (Metric): 1005; Min Operating Temperature: -55°C; Max Operating Temperature: 155°C; Tolerance: 1%; Resistor Type: Thick Film; Packaging: Tape and Reel; Voltage Rating: 50V; Termination: SMD/SMT; Features: Moisture Resistant; Series: RC; Number of Terminations: 2; Resistance Tolerance: 1%; Construction: Rectangular; Length: 1mm; Width: 0.5mm; Height: 0.32mm; Depth: 0.5mm; Lead Pitch: 0.2mm; REACH SVHC: No SVHC; Lead Free: Lead Free; Military Standard: Not; RoHS Compliant: Yes; ComponentLink1URL: https://datasheet.ciiva.com/7660/38568-7660787.pdf?src-supplier=Element14; ComponentLink1Description: https://datasheet.ciiva.com/7660/38568-7660787.pdf?src-supplier=Element14; ComponentLink2URL: https://datasheet.ciiva.com/7849/1686128-7849814.pdf?src-supplier=Element14; ComponentLink2Description: https://datasheet.ciiva.com/7849/1686128-7849814.pdf?src-supplier=Element14; ComponentLink3URL: https://datasheet.ciiva.com/7983/1018594-7983486.pdf?src-supplier=Element14; ComponentLink3Description: https://datasheet.ciiva.com/7983/1018594-7983486.pdf?src-supplier=Element14; ComponentLink4URL: https://datasheet.ciiva.com/22747/1018594-22747512.pdf?src-supplier=Element14; ComponentLink4Description: https://datasheet.ciiva.com/22747/1018594-22747512.pdf?src-supplier=Element14; ComponentLink5URL: https://datasheet.ciiva.com/12667/pyu-rc0402-51-rohs-l-6-r-12667067.pdf?src-supplier=Mouser; ComponentLink5Description: https://datasheet.ciiva.com/12667/pyu-rc0402-51-rohs-l-6-r-12667067.pdf?src-supplier=Mouser; ComponentLink6URL: https://datasheet.ciiva.com/7849/1784430-7849813.pdf?src-supplier=Element14; ComponentLink6Description: https://datasheet.ciiva.com/7849/1784430-7849813.pdf?src-supplier=Element14; Supplier Part Number 1: 603-RC0402FR-0710KL; LCSC Part Number: C60490; Working Voltage: 50V; ComponentLink7URL: https://datasheet.ciiva.com/7849/1784430-7849815.pdf?src-supplier=Element14; ComponentLink7Description: https://datasheet.ciiva.com/7849/1784430-7849815.pdf?src-supplier=Element14
R18 R19 R21 R22 = RC0603FR-074K7L: RES SMD 4.7K OHM 1% 1/10W 0603; Manufacturer: Yageo; Item Type: Resistor; Manufacturer Part Number: RC0603FR-074K7L; Package: 0603; ComponentLink7Description: LCSC; ComponentLink7URL: https://www.lcsc.com/product-detail/Chip-Resistor-Surface-Mount_YAGEO-RC0603FR-074K7L_C99782.html; LCSC Part Number: C99782
R83-R88 = RC0603FR-07680RL: RES SMD 680 OHM 1% 1/10W 0603; Manufacturer: Yageo; Item Type: Resistor; Manufacturer Part Number: RC0603FR-07680RL; Package: 0603; ComponentLink4URL: https://www.lcsc.com/product-detail/Chip-Resistor-Surface-Mount_YAGEO-RC0603FR-07680RL_C112310.html; ComponentLink4Description: LCSC; LCSC Part Number: C112310
SB1 = Solder Bridge 0603: Solder Bridge ON; Manufacturer Part Number: Solder Bridge; Item Type: Solder Bridge
TP1-TP6 = TEST POINT: Test Point ON; Item Type: TEST POINT
U3 = ADE9000ACPZ: IC AFE 7 CHAN 40LFCSP-WQ; Manufacturer: Analog Devices; Supplier: Mouser; Supplier Part Number: 584-ADE9000ACPZ; Manufacturer Part Number: ADE9000ACPZ; RoHS: Yes; Item Type: IC; Stock: 7889; Pricing: 1=18.44, 10=13.35, 50=10.79, 100=10.79, 1000=10.52, 10000=10.52 (USD); ComponentLink1URL: http://www.farnell.com/datasheets/2280571.pdf?src-supplier=Farnell; ComponentLink1Description: http://www.farnell.com/datasheets/2280571.pdf?src-supplier=Farnell; ComponentLink2URL: https://datasheet.octopart.com/ADE9000ACPZ-Analog-Devices-datasheet-165826959.pdf?src-supplier=Element14; ComponentLink2Description: https://datasheet.octopart.com/ADE9000ACPZ-Analog-Devices-datasheet-165826959.pdf?src-supplier=Element14; ComponentLink3URL: https://www.analog.com/media/en/technical-documentation/data-sheets/ADE9000.pdf?src-supplier=Digikey; ComponentLink3Description: https://www.analog.com/media/en/technical-documentation/data-sheets/ADE9000.pdf?src-supplier=Digikey
U4 U5 = ISO7741DWR: DGTL ISO 5000VRMS 4CH GP 16SOIC; Manufacturer: Texas Instruments; Item Type: IC; Number of Channels: 4; Isolated Power: No; Channel Type: Unidirectional; Data Rate: 100Mbps; Propagation Delay: 16ns; Pulse Width Distortion (PWD): 4.9ns; Supplier: Mouser; LCSC Part Number: C571196; Manufacturer Part Number: ISO7741DWR; RoHS: Yes; Stock: 8750; Pricing: 1=2.32, 10=1.36, 50=1.36, 100=1.29, 1000=1.22, 10000=1.1 (USD); Mounting Technology: Surface Mount; Case/Package: SOIC; Pins: 16; Min Operating Temperature: -55°C; Max Operating Temperature: 125°C; Type: General Purpose; Series: -; Packaging: Cut Tape; Lead Free: Lead Free; RoHS Compliant: Yes; ComponentLink1URL: http://www.ti.com/lit/ds/symlink/iso7741.pdf?src-supplier=Digikey; ComponentLink1Description: http://www.ti.com/lit/ds/symlink/iso7741.pdf?src-supplier=Digikey; ComponentLink2URL: http://www.ti.com/general/docs/suppproductinfo.tsp?distId=10&amp;gotoUrl=http%3A%2F%2Fwww.ti.com%2Flit%2Fgpn%2Fiso7741&src-supplier=Digikey; ComponentLink2Description: http://www.ti.com/general/docs/suppproductinfo.tsp?distId=10&amp;gotoUrl=http%3A%2F%2Fwww.ti.com%2Flit%2Fgpn%2Fiso7741&src-supplier=Digikey
X1 = X322524576MOB4SI: 24.576MHz Surface Mount Crystal 12pF ±10ppm ±20ppm SMD3225-4P Crystals ROHS; Manufacturer: YXC; Supplier: LCSC; LCSC Part Number: C70568; Manufacturer Part Number: X322524576MOB4SI; RoHS: No; Item Type: Crystal; ComponentLink1Description: LCSC; ComponentLink1URL: https://www.lcsc.com/product-detail/Crystals_YXC-Crystal-Oscillators-X322524576MOB4SI_C70568.html?s_z=n_X322524576MOB4SI